# Altium project EXP02_01_RGXXXX_STUDENT_ID.PrjPCB
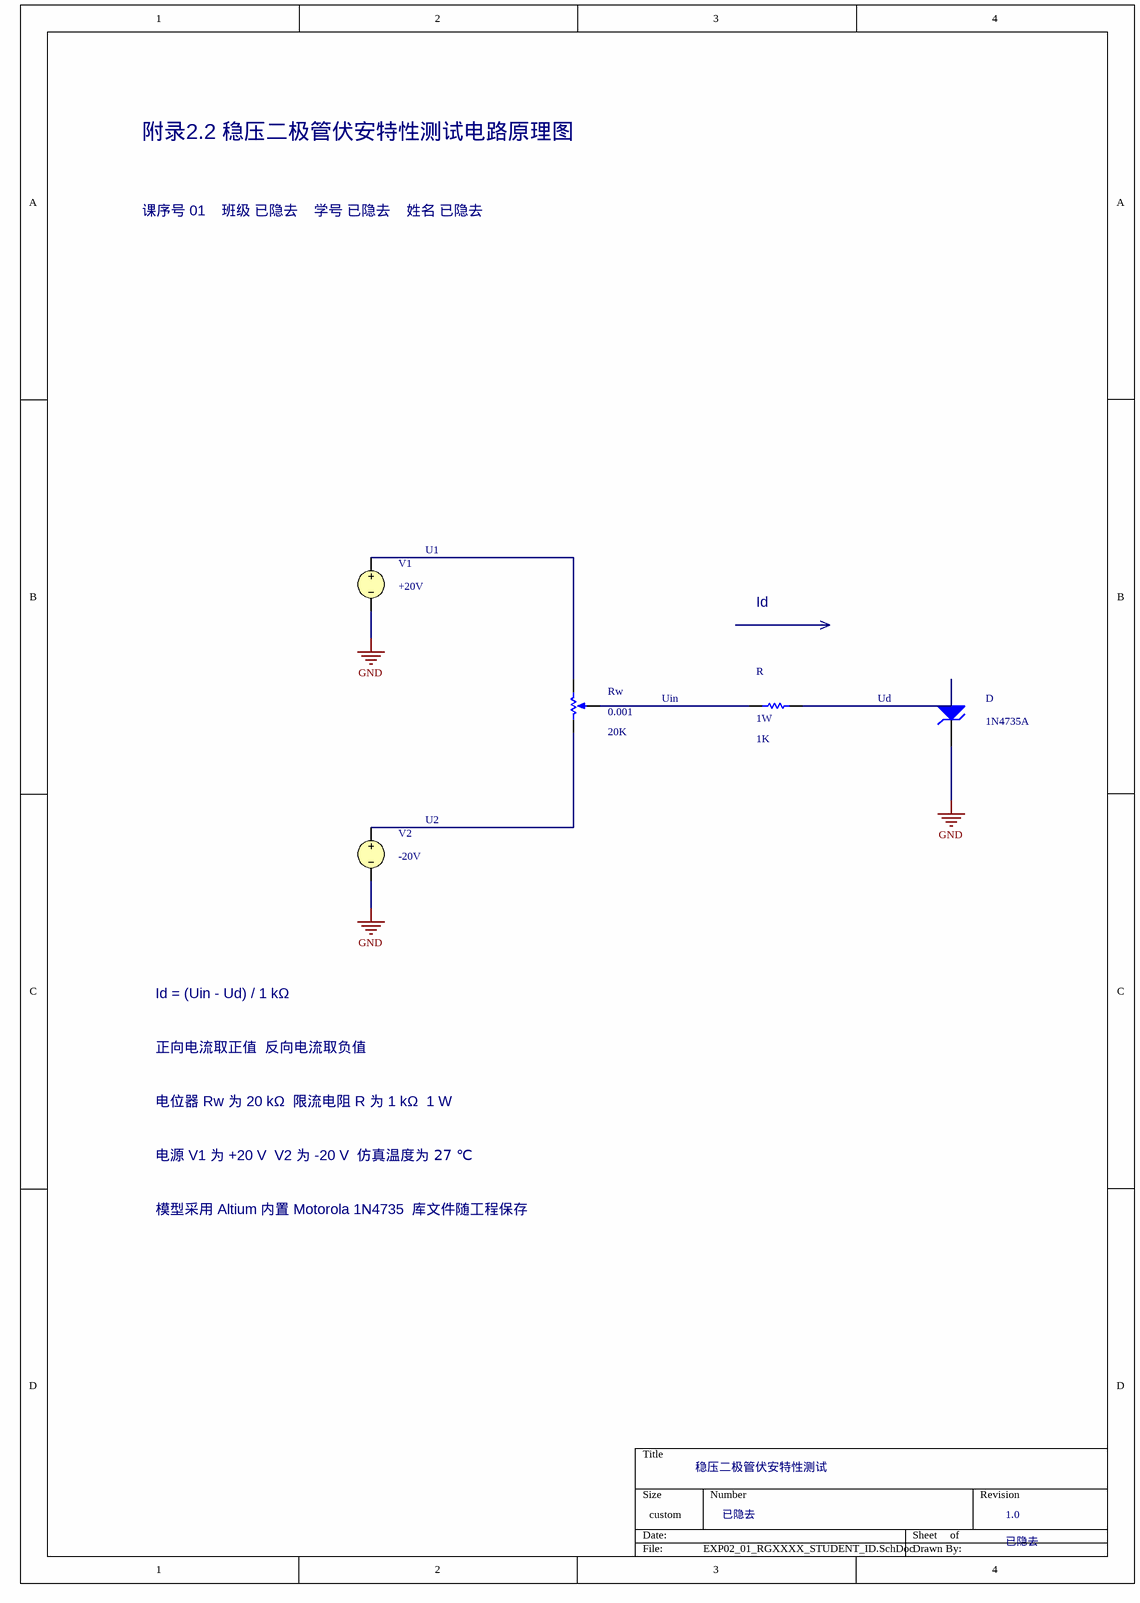
[diagram p0: EXP02_01_RGXXXX_STUDENT_ID.SchDoc]
1 sheet, 5 parts. Net scope: global (net labels, ports and power ports of the same name join across sheets).

## Sheet EXP02_01_RGXXXX_STUDENT_ID.SchDoc: Zener Diode I-V Test
size 209 x 296 mm; Date: 2026/11/12; DrawnBy: Anonymous; DocumentNumber: 已隐去; Revision: 1.0; SheetNumber: 1; SheetTotal: 1

### Parts
D  1N4735A  [59-03]
R  1W  value 1K  [AXIAL-0.3]
Rw  Set Position: 0.001  [VR5]  (hidden comment: 20K)
V1  +20V
V2  -20V

### Nets
GND: D.2(K) V1.2 V2.2
U1: Rw.1(TOP) V1.1
U2: Rw.2(BOT) V2.1
Ud: D.1(A) R.2
Uin: R.1 Rw.3(TAP)

### Notes on the sheet
- 附录2.2 稳压二极管伏安特性测试电路原理图
- 课序号 01    班级 已隐去    学号 已隐去    姓名 已隐去
- Id
- Id = (Uin - Ud) / 1 kΩ
- 正向电流取正值  反向电流取负值
- 电位器 Rw 为 20 kΩ  限流电阻 R 为 1 kΩ  1 W
- 电源 V1 为 +20 V  V2 为 -20 V  仿真温度为 27 ℃
- 模型采用 Altium 内置 Motorola 1N4735  库文件随工程保存
- 稳压二极管伏安特性测试
- 已隐去
- 1.0

### Library data of the parts
D = 1N4735A: One Watt Hermetically Sealed Glass Silicon Zener Diode; PackageReference: 59-03; Publisher: Altium Limited; Code_JEDEC: DO-204-AL; ComponentLink1Description: Manufacturer Link; Value: 1N4735A
R = Res1: Resistor; PackageReference: AXIAL-0.3; Publisher: Altium Limited
Rw = RPot: Potentiometer; PackageReference: VR5; Publisher: Altium Limited; Value: 20K
V1 = VSRC: Voltage Source; Note: PCB Footprint - Not required; Value: 20; PackageReference: Not Applicable; Publisher: Altium Limited
V2 = VSRC: Voltage Source; Note: PCB Footprint - Not required; Value: -20; PackageReference: Not Applicable; Publisher: Altium Limited